# Altium schematic sheet Schematic.SchDoc: Node Lora V1
size A3
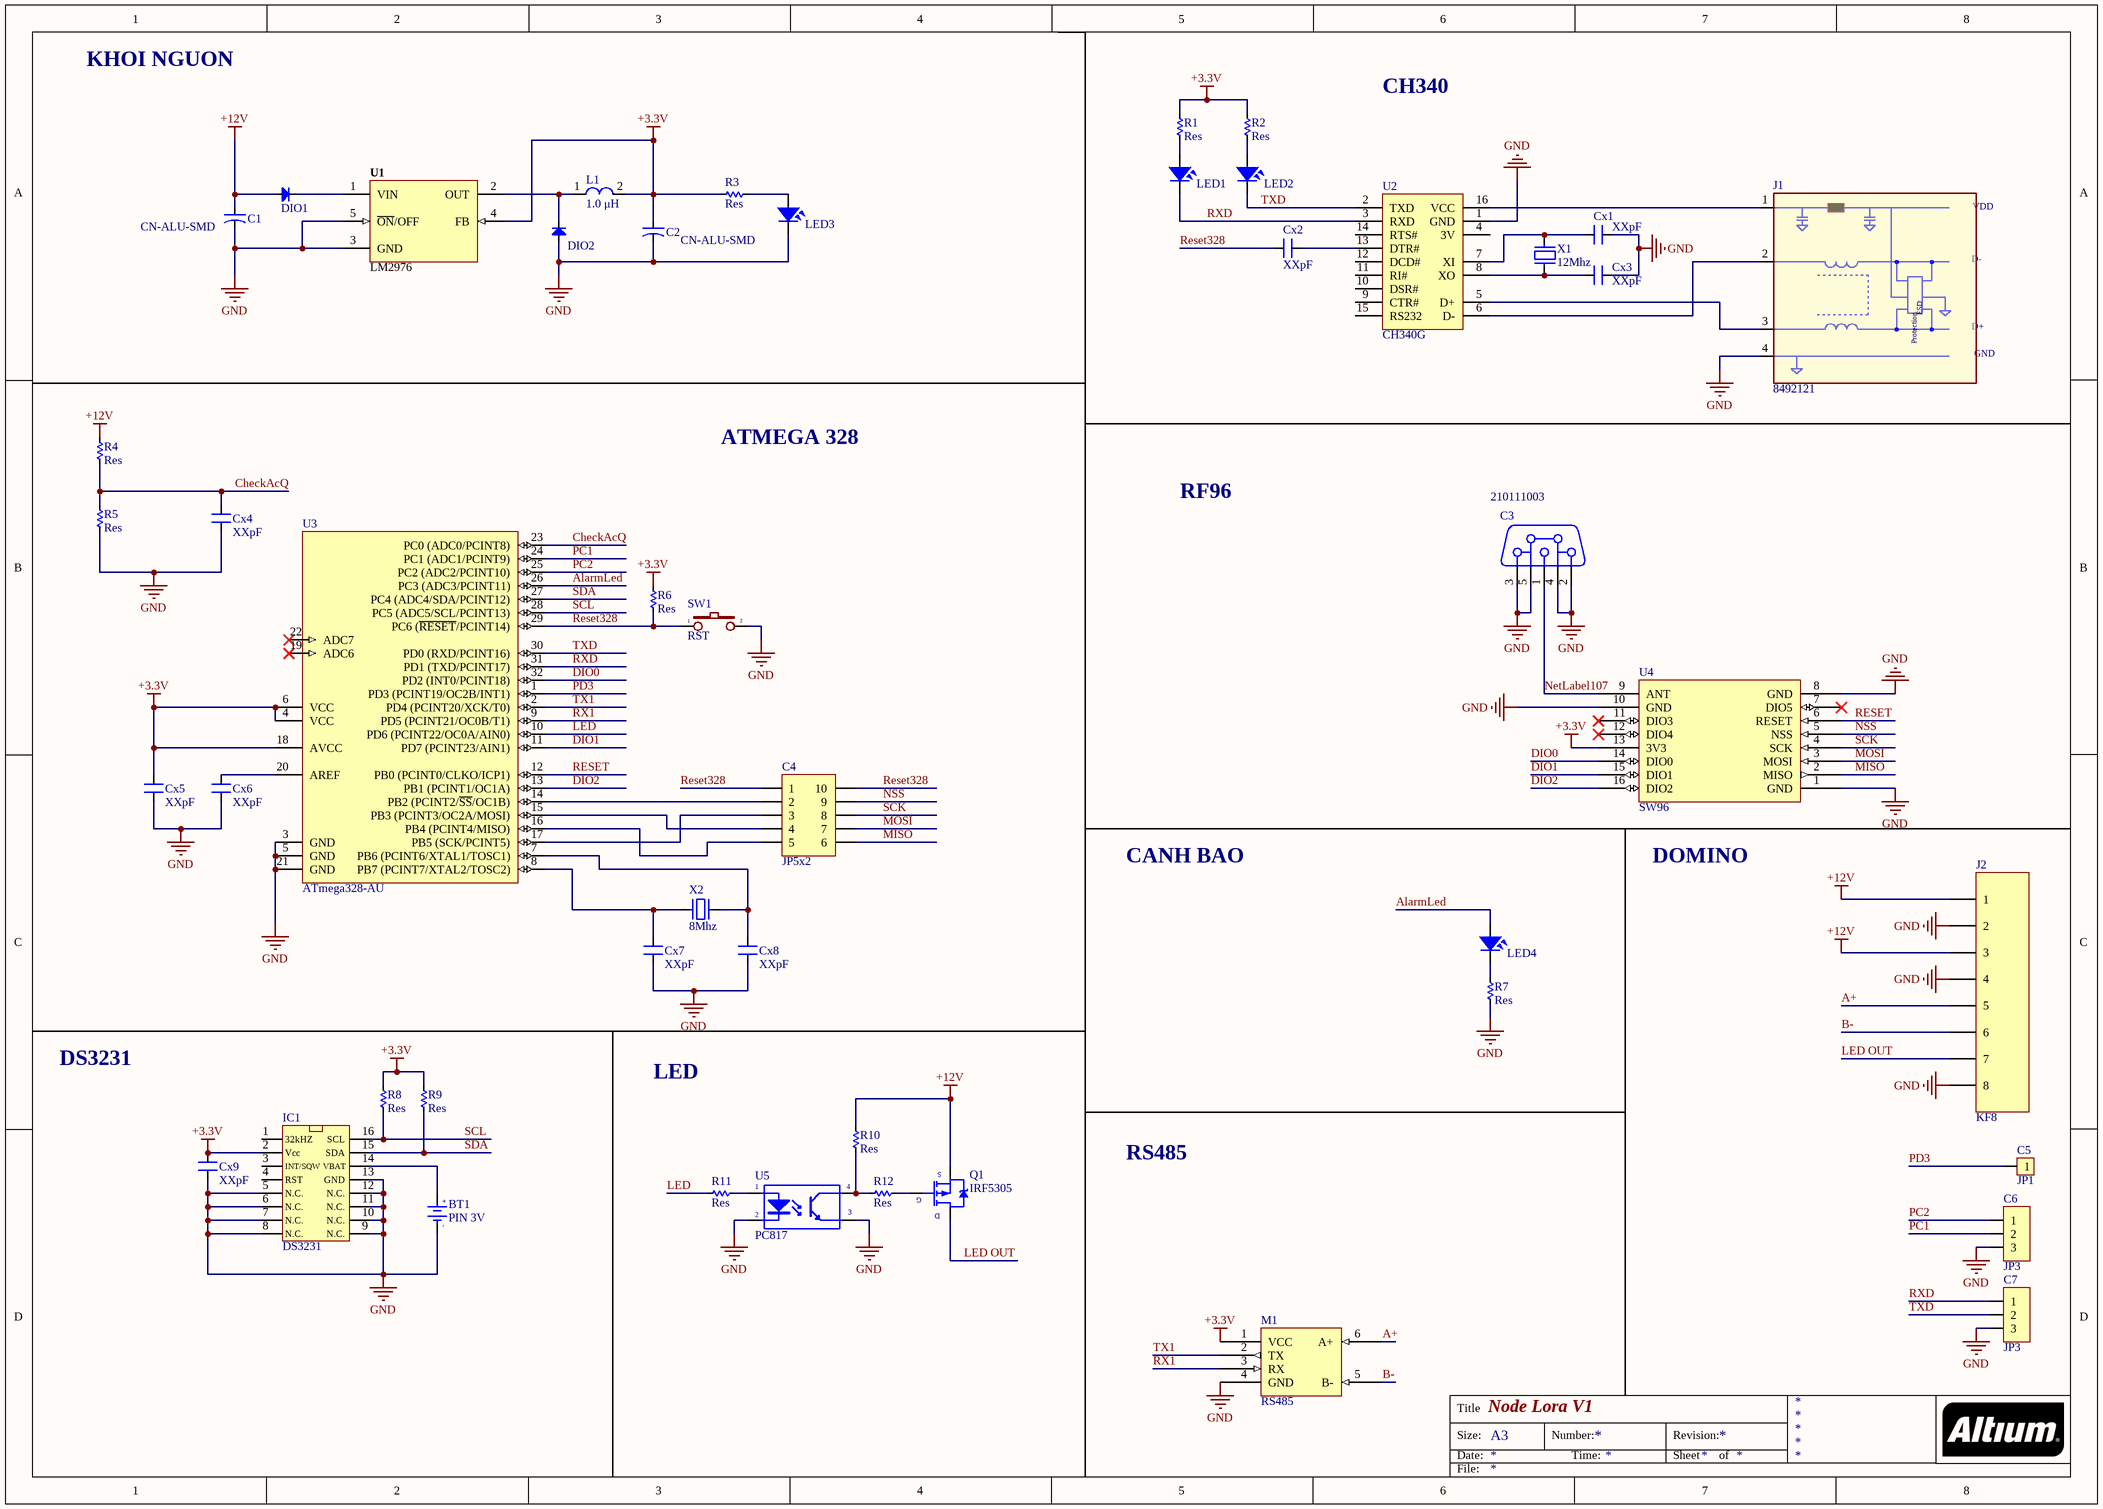
[diagram p0: Schematic.SchDoc]

## Parts
BT1  PIN 3V  [PIN3V]
C1  CN-ALU-SMD  [CAP-ALU-SMD-G]
C2  CN-ALU-SMD  [CAP-ALU-SMD-G]
C3  210111003  [SMA-RA]
C4  JP5x2  [JP5-D2T]
C5  JP1  [JP1-D1T]
C6  JP3  [JP3-D1T]
C7  JP3  [JP3-D1T]
Cx1  XXpF  [CN-SMD-0805]
Cx2  XXpF  [CN-SMD-0805]
Cx3  XXpF  [CN-SMD-0805]
Cx4  XXpF  [CN-SMD-0805]
Cx5  XXpF  [CN-SMD-0805]
Cx6  XXpF  [CN-SMD-0805]
Cx7  XXpF  [CN-SMD-0805]
Cx8  XXpF  [CN-SMD-0805]
Cx9  XXpF  [CN-SMD-0805]
DIO1  Diode SMD  [DIO-SMD-106]  (value not drawn)
DIO2  Diode SMD  [DIO-SMD-106]  (value not drawn)
IC1  DS3231  [DS3231]
J1  8492121  [USB-C2]
J2  KF8  [KF8-5]
L1  1.0 μH  [L-SMD-M-12x10]
LED1  LED  [LED-0805-Orange]  (value not drawn)
LED2  LED  [LED-0805-Green]  (value not drawn)
LED3  LED  [LED-0805-Green]  (value not drawn)
LED4  LED  [LED-5-Yellow]  (value not drawn)
M1  RS485  [RS485]
Q1  IRF5305  [IRF5305]
R1  Res  [RES-SMD-0805]
R2  Res  [RES-SMD-0805]
R3  Res  [RES-SMD-0805]
R4  Res  [RES-SMD-0805]
R5  Res  [RES-SMD-0805]
R6  Res  [RES-SMD-0805]
R7  Res  [RES-SMD-0805]
R8  Res  [RES-SMD-0805]
R9  Res  [RES-SMD-0805]
R10  Res  [RES-SMD-0805]
R11  Res  [RES-SMD-0805]
R12  Res  [RES-SMD-0805]
SW1  RST  [SW2]
U1  LM2976  [TO263]
U2  CH340G  [SO16]
U3  ATmega328-AU  [TQFP32]
U4  SW96  [RFM96]
U5  PC817  [DIP4]
X1  12Mhz  [XTAL-RU49/4]
X2  8Mhz  [XTAL-RU49/4]

## Nets
+3.3V: C2.1 Cx5.2 Cx9.2 IC1.2(Vcc) L1.2 M1.1(VCC) R1.1 R2.1 R3.2 R6.1 R8.1 R9.1 U1.4(FB) U3.4(VCC) U3.6(VCC) U3.18(AVCC) U4.13(3V3)
+12V: C1.1 DIO1.1(A) J2.1 J2.3 Q1.3(S) R4.1 R10.2
GND: BT1.2(GND) C1.2 C2.2 C3.2 C3.3 C3.4 C3.5 C6.3 C7.3 Cx1.1 Cx3.1 Cx4.1 Cx5.1 Cx6.1 Cx7.1 Cx8.1 Cx9.1 DIO2.1(A) IC1.5(N.C.) IC1.6(N.C.) IC1.7(N.C.) IC1.8(N.C.) IC1.9(N.C.) IC1.10(N.C.) IC1.11(N.C.) IC1.12(N.C.) IC1.13(GND) J1.4(GND) J2.2 J2.4 J2.8 LED3.2 M1.4(GND) R5.2 R7.1 SW1.2 U1.3(GND) U1.5(~{ON}/OFF) U2.1(GND) U3.3(GND) U3.5(GND) U3.21(GND) U4.1(GND) U4.8(GND) U4.10(GND) U5.2(K) U5.3(E)
A+: J2.5 M1.6(A+)
AlarmLed: LED4.1 U3.26(PC3_(ADC3/PCINT11))
B-: J2.6 M1.5(B-)
CheckAcQ: Cx4.2 R4.2 R5.1 U3.23(PC0_(ADC0/PCINT8))
DIO0: U3.32(PD2_(INT0/PCINT18)) U4.14(DIO0)
DIO1: U3.11(PD7_(PCINT23/AIN1)) U4.15(DIO1)
DIO2: U3.13(PB1_(PCINT1/OC1A)) U4.16(DIO2)
LED: R11.2 U3.10(PD6_(PCINT22/OC0A/AIN0))
LED OUT: J2.7 Q1.2(D)
MISO: C4.6 U4.2(MISO)
MOSI: C4.7 U4.3(MOSI)
NetLabel107: C3.1 U4.9(ANT)
NSS: C4.9 U4.5(NSS)
PC1: C6.2 U3.24(PC1_(ADC1/PCINT9))
PC2: C6.1 U3.25(PC2_(ADC2/PCINT10))
PD3: C5.1 U3.1(PD3_(PCINT19/OC2B/INT1))
RESET: U3.12(PB0_(PCINT0/CLKO/ICP1)) U4.6(RESET)
Reset328: C4.1 C4.10 Cx2.2 R6.2 SW1.1 U3.29(PC6_(~{RESET}/PCINT14))
RX1: M1.3(RX) U3.9(PD5_(PCINT21/OC0B/T1))
RXD: C7.1 LED1.2 U2.3(RXD) U3.31(PD1_(TXD/PCINT17))
SCK: C4.8 U4.4(SCK)
SCL: IC1.16(SCL) R8.2 U3.28(PC5_(ADC5/SCL/PCINT13))
SDA: IC1.15(SDA) R9.2 U3.27(PC4_(ADC4/SDA/PCINT12))
TX1: M1.2(TX) U3.2(PD4_(PCINT20/XCK/T0))
TXD: C7.2 LED2.2 U2.2(TXD) U3.30(PD0_(RXD/PCINT16))
NetBT1_1: BT1.1(+3V) IC1.14(VBAT)
NetC4_2: C4.2 U3.14(PB2_(PCINT2/~{SS}/OC1B))
NetC4_3: C4.3 U3.17(PB5_(SCK/PCINT5))
NetC4_4: C4.4 U3.15(PB3_(PCINT3/OC2A/MOSI))
NetC4_5: C4.5 U3.16(PB4_(PCINT4/MISO))
NetCx1_2: Cx1.2 U2.7(XI) X1.2
NetCx2_1: Cx2.1 U2.13(DTR#)
NetCx3_2: Cx3.2 U2.8(XO) X1.1
NetCx6_2: Cx6.2 U3.20(AREF)
NetCx7_2: Cx7.2 U3.8(PB7_(PCINT7/XTAL2/TOSC2)) X2.2
NetCx8_2: Cx8.2 U3.7(PB6_(PCINT6/XTAL1/TOSC1)) X2.1
NetDIO1_2: DIO1.2(K) U1.1(VIN)
NetDIO2_2: DIO2.2(K) L1.1 U1.2(OUT)
NetJ1_1: J1.1(VBUS) U2.16(VCC)
NetJ1_2: J1.2(D-) U2.6(D-)
NetJ1_3: J1.3(D+) U2.5(D+)
NetLED1_1: LED1.1 R1.2
NetLED2_1: LED2.1 R2.2
NetLED3_1: LED3.1 R3.1
NetLED4_2: LED4.2 R7.2
NetQ1_1: Q1.1(G) R12.2
NetR10_1: R10.1 R12.1 U5.4(C)
NetR11_1: R11.1 U5.1(A)

Not connected (* = marked no-connect by the designer): IC1 1(32kHZ) 3(INT/SQW) 4(RST); U2 4(3V) 9(CTR#) 10(DSR#) 11(RI#) 12(DCD#) 14(RTS#) 15(RS232); U3 19(ADC6)* 22(ADC7)*; U4 7(DIO5)* 11(DIO3)* 12(DIO4)*

## Notes on the sheet
- KHOI NGUON
- CH340
- ATMEGA 328
- RF96
- CANH BAO
- DOMINO
- DS3231
- LED
- RS485
- Title
- Size:
- Date:
- A3
- Number:
- Time:
- Revision:
- Sheet
- of
- File:
- (in symbol PIN 3V) +; -
- (in symbol USB-4) VDD; ESD; Protection

## Library data of the parts
BT1 = PIN 3V: Battery 3VDC; Value: PIN 3V
C1 C2 = CN-ALU-SMD: Polarized Capacitor (Axial); Published: 8-Jun-2000; LatestRevisionDate: 17-Jul-2002; LatestRevisionNote: Re-released for DXP Platform.; PackageReference: POLAR0.8; Publisher: Altium Limited
C3 = CON Ant: CONNECTOR ANTEN; Manufacturer: Würth Elektronik eiSos GmbH; partNo: 210111003; ComponentLink1Description: Manufacturer; ComponentLink1URL: http://www.we-online.de; Created by: Christin Zierenner; Created Date: May 2012; ComponentLink2Description: Datasheet; ComponentLink2URL: http://katalog.we-online.de/kataloge/eisos/index.php?language=en&pf=Filter_gerade
C4 = JP5x2: WR-PHD 2.54 mm Dual Socket Header; Manufacturer: W¨¹rth Elektronik eiSos GmbH; partNo: 61301021821; ComponentLink1 Description: Manufacturer; ComponentLink2 Description: Datasheet; NoPins: 10; Created Date: 29 March 2013; ComponentLink1URL: http://www.we-online.com; ComponentLink2URL: http://katalog.we-online.de/em/datasheet/6130xx21821.pdf; Created by: Karrer Zheng
C5 = JP1: WR-PHD 2.54 mm Angled Socket Header; Manufacturer: W¨¹rth Elektronik eiSos GmbH; partNo: 613002143121; ComponentLink1 Description: Manufacturer; ComponentLink2 Description: Datasheet; NoPins: 02; Created Date: 29 March 2013; ComponentLink1URL: http://www.we-online.com; ComponentLink2URL: http://katalog.we-online.de/em/datasheet/6130xx143121.pdf; Created by: Karrer Zheng
C6 C7 = JP3: WR-PHD 2.54 mm Angled Socket Header; Manufacturer: W¨¹rth Elektronik eiSos GmbH; partNo: 613003143121; ComponentLink1 Description: Manufacturer; ComponentLink2 Description: Datasheet; NoPins: 03; Created Date: 29 March 2013; ComponentLink1URL: http://www.we-online.com; ComponentLink2URL: http://katalog.we-online.de/em/datasheet/6130xx143121.pdf; Created by: Karrer Zheng
Cx1-Cx9 = CN: Value: 33pF
DIO1 DIO2 = Diode SMD: Default Diode; Code - JEDEC: DO-214-AB; Value: 1N5007; Published: 8-Jun-2000; Revision: July-2002: Re-released for DXP Platform.; Publisher: Altium Limited
J1 = USB-4: THT USB 2.0 A Connector WE-EPLE; Manufacturer: Würth Elektronik eiSos GmbH; PartNo: 8492121; ComponentLink1Description: Manufacturer; ComponentLink1URL: http://www.we-online.de; Created by: Christin Otto; Created Date: OCT-2014; ComponentLink2Description: Datasheet; ComponentLink2URL: http://www.we-online.de/katalog/media/pdf/8492121.pdf
J2 = KF8: Manufacturer: W¨¹rth Elektronik eiSos GmbH; PartNo: 691133710008; ComponentLink1 Description: Manufacturer; ComponentLink2 Description: Datasheet; NoPins: 8; ComponentLink1 URL: http://www.we-online.com; ComponentLink2 URL: http://katalog.we-online.de/em/datasheet/6911337100xx.pdf; Created By: Baojun Chen; Created Date: 4-Aug-15
L1 = L-SMD-1: partNo: 78477010; Manufacturer: Wurth Elektronik; Inductance: 1.0 μH; ComponentLink1Description: Manufacturer; ComponentLink1URL: http://www.we-online.de; Created by: Baojun Chen; Created Date: Nov.2015; ComponentLink2Description: Datasheet; ComponentLink2URL: http://katalog.we-online.de/pbs/datasheet/78477010.pdf
LED1-LED3 = LED SMD: Value: LED 3 - 5 ly 2 Colour
LED4 = LED: LED Single colour Green and Red; Value: LED 3 ly Single Colour
R1-R12 = Res-SMD: Resistor; Manufacturer: Generic Components; Class: Passive; Published: 08/06/2000; Publisher: Altium Hobart Technology Centre
SW1 = SW2: Switch button 2 pin; Value: SW chip 2 pin
U1 = LM2596: Max Input Voltage: 12 V; Max Output Current: 3 (6.0 peak) A; Max Output Voltage: mV; Category: IC-Power; Min Input Voltage: mV; Min Output Voltage: mV; Mounting Technology: Surface Mount; Status: Unreleased; Supply Voltage: mV; Temperature Range: -40 to +125 degC
U2 = CH340G: High and Low Side Driver; Note: Pins 4, 8 and 14 are not connected; Published: 8-Jun-2000; LatestRevisionDate: 04-Mar-2005; LatestRevisionNote: Stylized 3D Model Added.; DatasheetVersion: PD60147J; PackageReference: PDIP14; Publisher: Altium Limited; PackageDescription: DIP; 14 Leads; Row Spacing 7.62 mm; Pitch 2.54 mm; ComponentLink1Description: Manufacturer Link; ComponentLink1URL: http://www.irf.com/; ComponentLink2Description: Datasheet; ComponentLink2URL: http://www.irf.com/product-info/datasheets/data/ir2110.pdf
U3 = ATmega328-AU: 8-bit AVR Microcontroller, 32KB Flash, 1KB EEPROM, 2KB SRAM, 32-pin TQFP, Industrial Grade (-40°C to 85°C); Published: 1-Apr-2010; DatasheetVersion: revA, Jan-2010; PackageVersion: revB, Oct-2001; PackageReference: 32A; Publisher: Altium Limited; PackageDescription: 32-Lead, 7x7x1.0 mm Body, 0.8mm Lead Pitch, Thin Profile Plastic Quad Flat Package (TQFP); Supplier 1: Digi-Key; Supplier Part Number 1: ATMEGA328-AU-ND; Supplier 2: Mouser; Supplier Part Number 2: 556-ATMEGA328-AU; Code_JEDEC: MS-026-ABA; ComponentLink1Description: Manufacturer Link; ComponentLink1URL: http://www.atmel.com/products/avr/default.asp?; ComponentLink2Description: ATmega48A/48PA/88A/88PA/168A/168PA/328/328P Datasheet; ComponentLink2URL: http://www.atmel.com/dyn/resources/prod_documents/8271.pdf; ComponentLink3Description: ATmega48A/48PA/88A/88PA/168A/168PA/328/328P Summary; ComponentLink3URL: http://www.atmel.com/dyn/resources/prod_documents/8271S.pdf; ComponentLink4Description: Atmel.com Home; ComponentLink4URL: http://www.atmel.com
U5 = PC817: Single Opto; Value: PC817
X1 X2 = XT2: Crystal, 32.768 KHz, -40 to 85 degC, 3.2 x 1.5 x 0.9 mm SMD; Value: 4Mhz